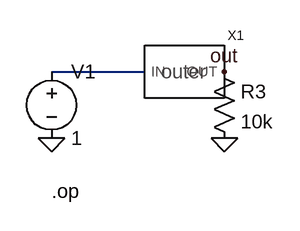
[diagram p0: schematic nest_top.asc]
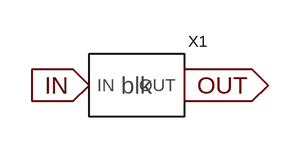
[diagram p1: sub-circuit outer.asc]
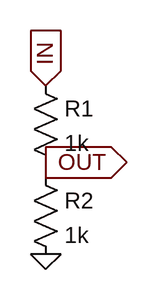
[diagram p2: sub-circuit blk.asc]
nest_top.asc, the LTspice schematic file:
Version 4
SHEET 1 880 680
WIRE 0 16 112 16
FLAG 0 96 0
FLAG 208 16 out
FLAG 208 96 0
SYMBOL voltage 0 0 R0
SYMATTR InstName V1
SYMATTR Value 1
SYMBOL outer 160 16 R0
SYMATTR InstName X1
SYMBOL res 192 0 R0
SYMATTR InstName R3
SYMATTR Value 10k
TEXT 0 160 Left 2 !.op

outer.asc, the sub-circuit schematic file:
Version 4
SHEET 1 880 680
FLAG 112 16 IN
IOPIN 112 16 In
FLAG 208 16 OUT
IOPIN 208 16 Out
SYMBOL blk 160 16 R0
SYMATTR InstName X1

blk.asc, the sub-circuit schematic file:
Version 4
SHEET 1 880 680
WIRE 0 96 0 112
FLAG 0 16 IN
IOPIN 0 16 In
FLAG 0 96 OUT
IOPIN 0 96 Out
FLAG 0 192 0
SYMBOL res -16 0 R0
SYMATTR InstName R1
SYMATTR Value 1k
SYMBOL res -16 96 R0
SYMATTR InstName R2
SYMATTR Value 1k

The netlist it stands for:
* nest_top.asc
V1 N001 0 1
XX1 N001 out outer
R3 out 0 10k

* block symbol definitions
.subckt outer IN OUT
XX1 IN OUT blk
.ends outer

.subckt blk IN OUT
R1 IN OUT 1k
R2 OUT 0 1k
.ends blk

.op
.backanno
.end